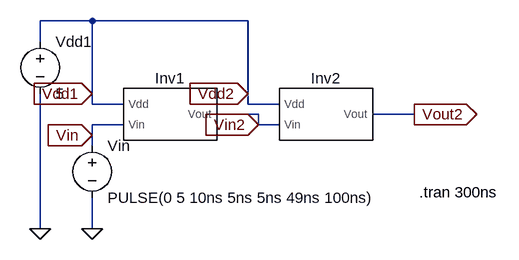
[diagram p0: schematic Draft2.asc]
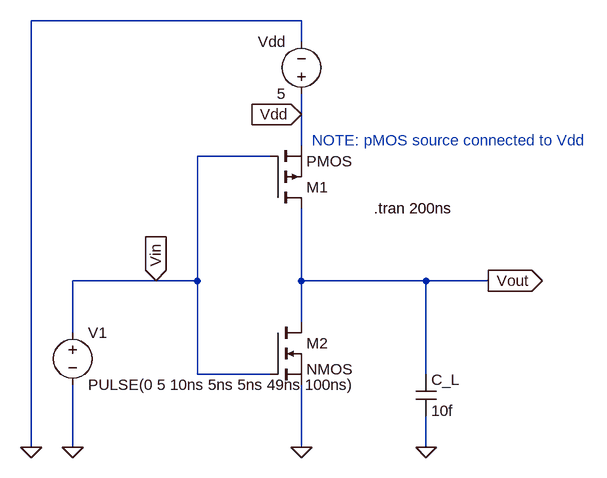
[diagram p1: sub-circuit inverter.asc]
Draft2.asc, the LTspice schematic file:
Version 4.1
SHEET 1 880 680
WIRE 16 0 -64 0
WIRE 256 0 16 0
WIRE -64 32 -64 0
WIRE 16 112 16 0
WIRE 256 112 256 0
WIRE 16 128 16 112
WIRE 64 128 16 128
WIRE 256 128 256 112
WIRE 304 128 256 128
WIRE 272 144 208 144
WIRE 512 144 448 144
WIRE 64 160 16 160
WIRE 272 160 272 144
WIRE 304 160 272 160
WIRE 16 176 16 160
WIRE 16 192 16 176
WIRE -64 320 -64 112
WIRE 16 320 16 272
FLAG -64 320 0
FLAG 512 144 Vout2
IOPIN 512 144 Out
FLAG 16 320 0
FLAG 16 176 Vin
IOPIN 16 176 In
FLAG 16 112 Vdd1
IOPIN 16 112 In
FLAG 256 112 Vdd2
IOPIN 256 112 In
FLAG 272 160 Vin2
IOPIN 272 160 In
SYMBOL voltage -64 16 R0
WINDOW 123 0 0 Left 0
WINDOW 39 0 0 Left 0
SYMATTR InstName Vdd1
SYMATTR Value 5
SYMBOL voltage 16 176 R0
WINDOW 123 0 0 Left 0
WINDOW 39 0 0 Left 0
SYMATTR InstName Vin
SYMATTR Value PULSE(0 5 10ns 5ns 5ns 49ns 100ns)
SYMBOL Inverter 128 144 R0
SYMATTR InstName Inv1
SYMBOL Inverter 368 144 R0
SYMATTR InstName Inv2
TEXT 520 264 Left 2 !.tran 300ns

inverter.asc, the sub-circuit schematic file:
Version 4.1
SHEET 1 1008 680
WIRE 208 -400 -208 -400
WIRE 208 -368 208 -400
WIRE 208 -256 208 -288
WIRE 208 -208 208 -256
WIRE 160 -192 48 -192
WIRE -16 0 -144 0
WIRE 48 0 48 -192
WIRE 48 0 -16 0
WIRE 208 0 208 -112
WIRE 400 0 208 0
WIRE 496 0 400 0
WIRE 208 64 208 0
WIRE -144 80 -144 0
WIRE 48 144 48 0
WIRE 160 144 48 144
WIRE 400 144 400 0
WIRE -208 256 -208 -400
WIRE -144 256 -144 160
WIRE 208 256 208 160
WIRE 400 256 400 208
FLAG 496 0 Vout
IOPIN 496 0 Out
FLAG -16 0 Vin
IOPIN -16 0 In
FLAG -208 256 0
FLAG -144 256 0
FLAG 208 256 0
FLAG 400 256 0
FLAG 208 -256 Vdd
IOPIN 208 -256 In
SYMBOL cap 384 144 R0
SYMATTR InstName C_L
SYMATTR Value 10f
SYMBOL nmos 160 64 R0
SYMATTR InstName M2
SYMBOL pmos 160 -112 M180
SYMATTR InstName M1
SYMBOL voltage -144 64 R0
WINDOW 123 0 0 Left 0
WINDOW 39 0 0 Left 0
SYMATTR InstName V1
SYMATTR Value PULSE(0 5 10ns 5ns 5ns 49ns 100ns)
SYMBOL voltage 208 -272 R180
WINDOW 0 24 96 Left 2
WINDOW 3 24 16 Left 2
WINDOW 123 0 0 Left 0
WINDOW 39 0 0 Left 0
SYMATTR InstName Vdd
SYMATTR Value 5
TEXT 224 -216 Left 2 ;NOTE: pMOS source connected to Vdd
TEXT 320 -112 Left 2 !.tran 200ns

The netlist it stands for:
* Draft2.asc
Vdd1 Vdd2 0 5
Vin Vin 0 PULSE(0 5 10ns 5ns 5ns 49ns 100ns)
X§Inv1 Vdd2 Vin Vin2 inverter
X§Inv2 Vdd2 Vin2 Vout2 inverter

* block symbol definitions
.subckt inverter Vdd Vin Vout
C_L Vout 0 10f
M2 Vout Vin 0 0 NMOS
M1 Vout Vin Vdd Vdd PMOS
V1 Vin 0 PULSE(0 5 10ns 5ns 5ns 49ns 100ns)
Vdd Vdd 0 5
* NOTE: pMOS source connected to Vdd
.tran 200ns
.ends inverter

.model NMOS NMOS
.model PMOS PMOS
.lib standard.mos
.tran 300ns
.backanno
.end